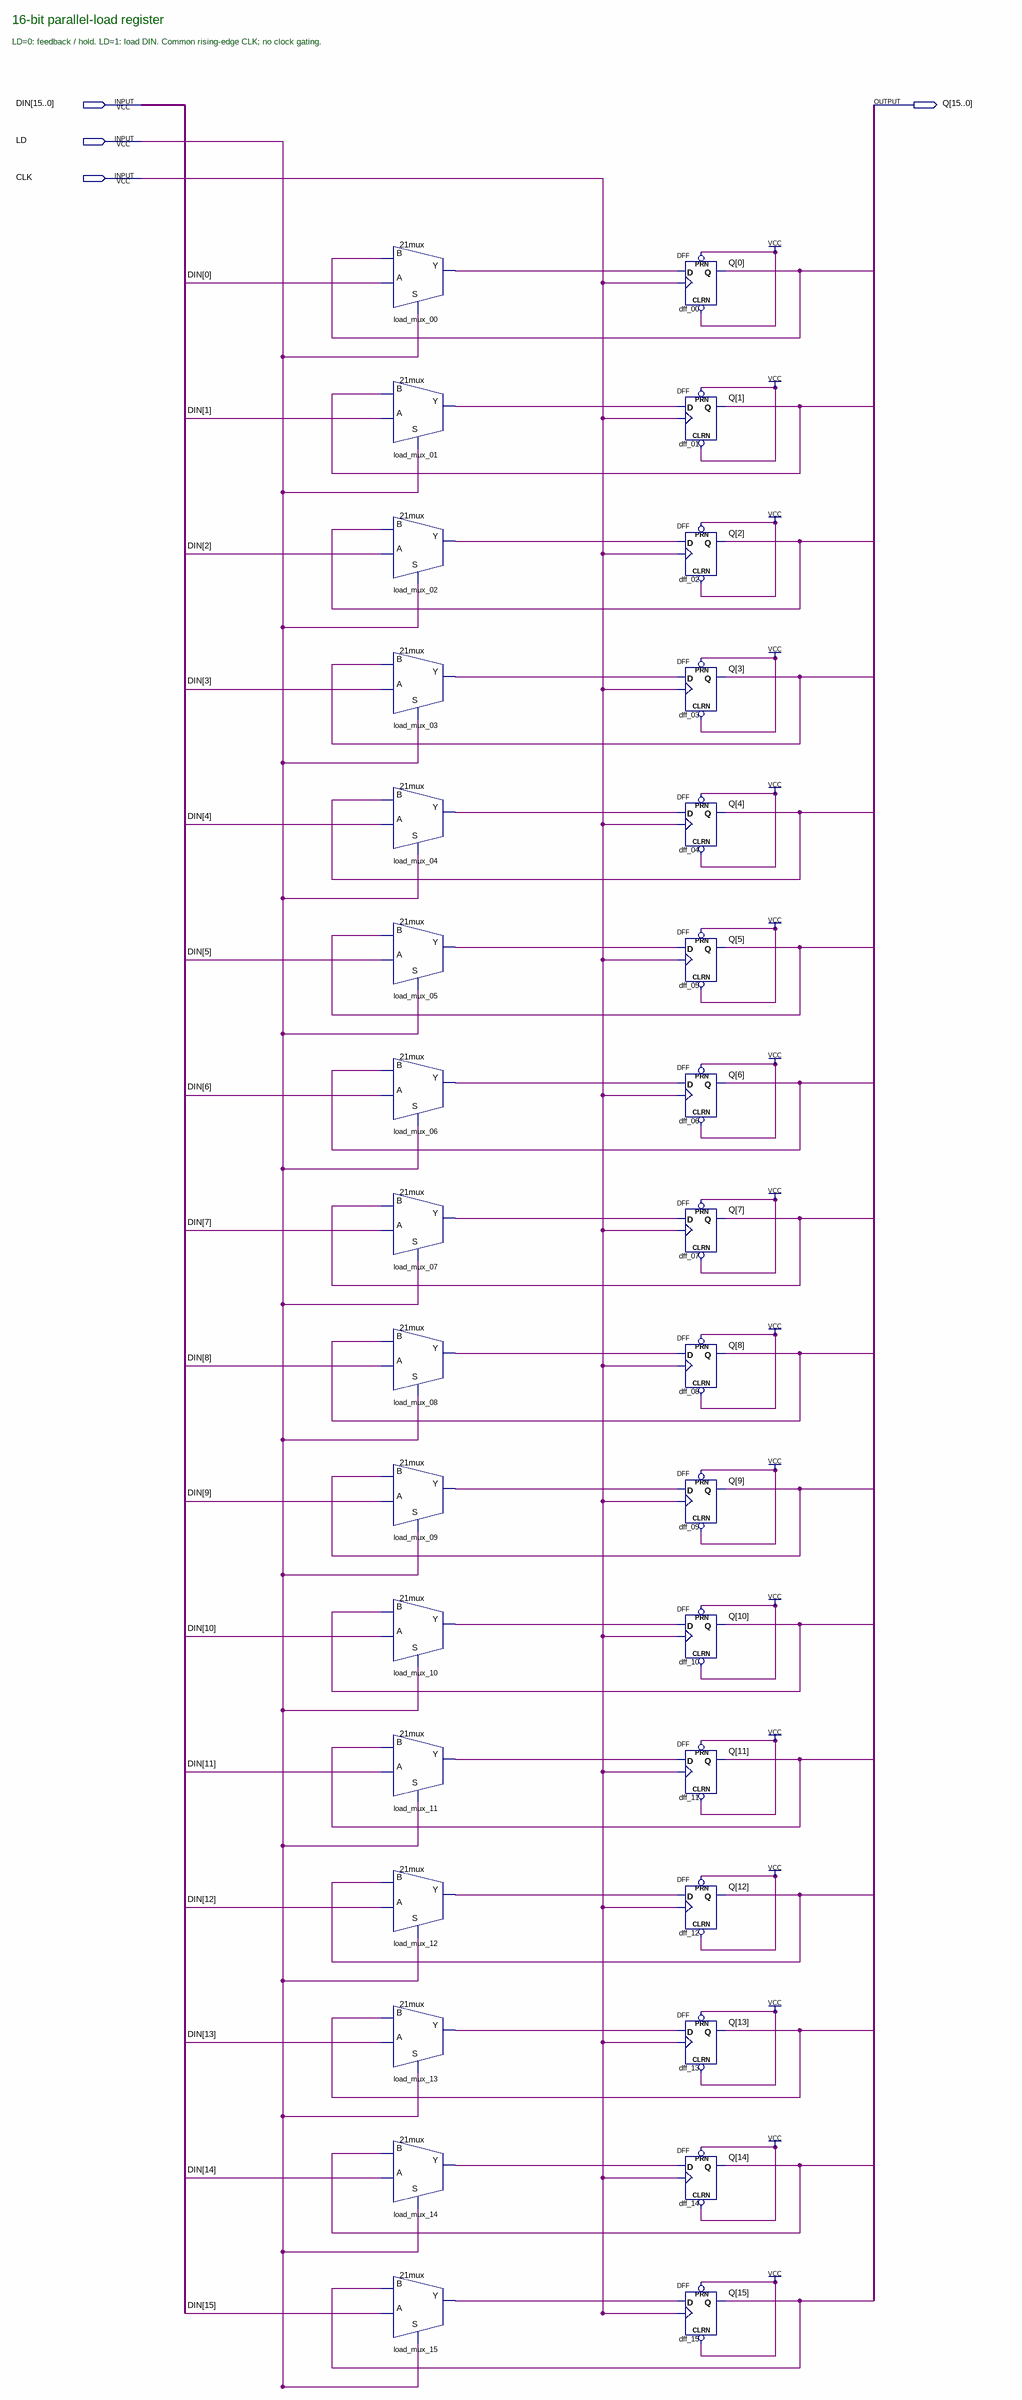
[diagram p0: schematic sheet]
// Quartus schematic register16.bdf as structural Verilog: 32 symbols, 4 pins
module register16 (
  input  [15:0] DIN,
  input  LD,
  input  CLK,
  output [15:0] Q
);

  wire NEXT_0, NEXT_1, NEXT_2, NEXT_3, NEXT_4, NEXT_5, NEXT_6, NEXT_7, NEXT_8, NEXT_9, NEXT_10, NEXT_11,
       NEXT_12, NEXT_13, NEXT_14, NEXT_15;

  \21mux  load_mux_00 (.B(Q[0]), .A(DIN[0]), .S(LD), .Y(NEXT_0));
  \21mux  load_mux_01 (.B(Q[1]), .A(DIN[1]), .S(LD), .Y(NEXT_1));
  \21mux  load_mux_02 (.B(Q[2]), .A(DIN[2]), .S(LD), .Y(NEXT_2));
  \21mux  load_mux_03 (.B(Q[3]), .A(DIN[3]), .S(LD), .Y(NEXT_3));
  \21mux  load_mux_04 (.B(Q[4]), .A(DIN[4]), .S(LD), .Y(NEXT_4));
  \21mux  load_mux_05 (.B(Q[5]), .A(DIN[5]), .S(LD), .Y(NEXT_5));
  \21mux  load_mux_06 (.B(Q[6]), .A(DIN[6]), .S(LD), .Y(NEXT_6));
  \21mux  load_mux_07 (.B(Q[7]), .A(DIN[7]), .S(LD), .Y(NEXT_7));
  \21mux  load_mux_08 (.B(Q[8]), .A(DIN[8]), .S(LD), .Y(NEXT_8));
  \21mux  load_mux_09 (.B(Q[9]), .A(DIN[9]), .S(LD), .Y(NEXT_9));
  \21mux  load_mux_10 (.B(Q[10]), .A(DIN[10]), .S(LD), .Y(NEXT_10));
  \21mux  load_mux_11 (.B(Q[11]), .A(DIN[11]), .S(LD), .Y(NEXT_11));
  \21mux  load_mux_12 (.B(Q[12]), .A(DIN[12]), .S(LD), .Y(NEXT_12));
  \21mux  load_mux_13 (.B(Q[13]), .A(DIN[13]), .S(LD), .Y(NEXT_13));
  \21mux  load_mux_14 (.B(Q[14]), .A(DIN[14]), .S(LD), .Y(NEXT_14));
  \21mux  load_mux_15 (.B(Q[15]), .A(DIN[15]), .S(LD), .Y(NEXT_15));
  DFF dff_00 (.CLRN(1'b1), .CLK(CLK), .D(NEXT_0), .PRN(1'b1), .Q(Q[0]));
  DFF dff_01 (.CLRN(1'b1), .CLK(CLK), .D(NEXT_1), .PRN(1'b1), .Q(Q[1]));
  DFF dff_02 (.CLRN(1'b1), .CLK(CLK), .D(NEXT_2), .PRN(1'b1), .Q(Q[2]));
  DFF dff_03 (.CLRN(1'b1), .CLK(CLK), .D(NEXT_3), .PRN(1'b1), .Q(Q[3]));
  DFF dff_04 (.CLRN(1'b1), .CLK(CLK), .D(NEXT_4), .PRN(1'b1), .Q(Q[4]));
  DFF dff_05 (.CLRN(1'b1), .CLK(CLK), .D(NEXT_5), .PRN(1'b1), .Q(Q[5]));
  DFF dff_06 (.CLRN(1'b1), .CLK(CLK), .D(NEXT_6), .PRN(1'b1), .Q(Q[6]));
  DFF dff_07 (.CLRN(1'b1), .CLK(CLK), .D(NEXT_7), .PRN(1'b1), .Q(Q[7]));
  DFF dff_08 (.CLRN(1'b1), .CLK(CLK), .D(NEXT_8), .PRN(1'b1), .Q(Q[8]));
  DFF dff_09 (.CLRN(1'b1), .CLK(CLK), .D(NEXT_9), .PRN(1'b1), .Q(Q[9]));
  DFF dff_10 (.CLRN(1'b1), .CLK(CLK), .D(NEXT_10), .PRN(1'b1), .Q(Q[10]));
  DFF dff_11 (.CLRN(1'b1), .CLK(CLK), .D(NEXT_11), .PRN(1'b1), .Q(Q[11]));
  DFF dff_12 (.CLRN(1'b1), .CLK(CLK), .D(NEXT_12), .PRN(1'b1), .Q(Q[12]));
  DFF dff_13 (.CLRN(1'b1), .CLK(CLK), .D(NEXT_13), .PRN(1'b1), .Q(Q[13]));
  DFF dff_14 (.CLRN(1'b1), .CLK(CLK), .D(NEXT_14), .PRN(1'b1), .Q(Q[14]));
  DFF dff_15 (.CLRN(1'b1), .CLK(CLK), .D(NEXT_15), .PRN(1'b1), .Q(Q[15]));

  // Notes on the sheet:
  //   16-bit parallel-load register
  //   LD=0: feedback / hold. LD=1: load DIN. Common rising-edge CLK; no clock gating.
endmodule
